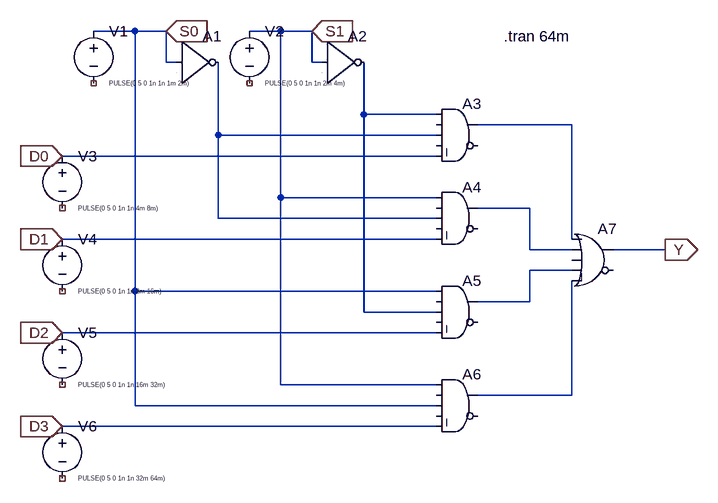
[diagram p0: schematic mux.asc]
mux.asc, the LTspice schematic file:
Version 4.1
SHEET 1 956 952
WIRE 64 224 0 224
WIRE 112 224 64 224
WIRE 288 224 240 224
WIRE 336 224 288 224
WIRE 112 272 112 224
WIRE 128 272 112 272
WIRE 336 272 336 224
WIRE 352 272 336 272
WIRE 416 352 416 272
WIRE 528 352 416 352
WIRE 736 368 592 368
WIRE 192 384 192 272
WIRE 528 384 192 384
WIRE 528 416 -48 416
WIRE 288 480 288 224
WIRE 528 480 288 480
WIRE 672 496 592 496
WIRE 192 512 192 384
WIRE 528 512 192 512
WIRE 528 544 -48 544
WIRE 736 544 736 368
WIRE 672 560 672 496
WIRE 736 560 672 560
WIRE 880 560 800 560
WIRE 736 592 672 592
WIRE 64 624 64 224
WIRE 528 624 64 624
WIRE 672 640 672 592
WIRE 672 640 592 640
WIRE 416 656 416 352
WIRE 528 656 416 656
WIRE 528 688 -48 688
WIRE 288 768 288 480
WIRE 528 768 288 768
WIRE 736 784 736 608
WIRE 736 784 592 784
WIRE 64 800 64 624
WIRE 528 800 64 800
WIRE 528 832 -48 832
FLAG 112 224 S0
IOPIN 112 224 In
FLAG 336 224 S1
IOPIN 336 224 In
FLAG 880 560 Y
IOPIN 880 560 Out
FLAG -48 416 D0
IOPIN -48 416 In
FLAG -48 544 D1
IOPIN -48 544 In
FLAG -48 688 D2
IOPIN -48 688 In
FLAG -48 832 D3
IOPIN -48 832 In
SYMBOL voltage 0 208 R0
WINDOW 3 24 96 Left 0
WINDOW 123 0 0 Left 0
WINDOW 39 0 0 Left 0
SYMATTR Value PULSE(0 5 0 1n 1n 1m 2m)
SYMATTR InstName V1
SYMBOL voltage 240 208 R0
WINDOW 3 24 96 Left 0
SYMATTR Value PULSE(0 5 0 1n 1n 2m 4m)
SYMATTR InstName V2
SYMBOL Digital\\inv 128 208 R0
SYMATTR InstName A1
SYMBOL Digital\\inv 352 208 R0
SYMATTR InstName A2
SYMBOL Digital\\and 560 320 R0
SYMATTR InstName A3
SYMBOL Digital\\and 560 448 R0
SYMATTR InstName A4
SYMBOL Digital\\and 560 592 R0
SYMATTR InstName A5
SYMBOL Digital\\and 560 736 R0
SYMATTR InstName A6
SYMBOL voltage -48 400 R0
WINDOW 3 24 96 Left 0
WINDOW 123 0 0 Left 0
WINDOW 39 0 0 Left 0
SYMATTR Value PULSE(0 5 0 1n 1n 4m 8m)
SYMATTR InstName V3
SYMBOL Digital\\or 768 512 R0
SYMATTR InstName A7
SYMBOL voltage -48 528 R0
WINDOW 3 24 96 Left 0
WINDOW 123 0 0 Left 0
WINDOW 39 0 0 Left 0
SYMATTR Value PULSE(0 5 0 1n 1n 8m 16m)
SYMATTR InstName V4
SYMBOL voltage -48 672 R0
WINDOW 3 24 96 Left 0
WINDOW 123 0 0 Left 0
WINDOW 39 0 0 Left 0
SYMATTR Value PULSE(0 5 0 1n 1n 16m 32m)
SYMATTR InstName V5
SYMBOL voltage -48 816 R0
WINDOW 3 24 96 Left 0
WINDOW 123 0 0 Left 0
WINDOW 39 0 0 Left 0
SYMATTR Value PULSE(0 5 0 1n 1n 32m 64m)
SYMATTR InstName V6
TEXT 632 232 Left 2 !.tran 64m

The netlist it stands for:
* mux.asc
V1 S0 NC_01 PULSE(0 5 0 1n 1n 1m 2m)
V2 S1 NC_02 PULSE(0 5 0 1n 1n 2m 4m)
A1 S0 0 0 0 0 N003 0 0 BUF
A2 S1 0 0 0 0 N001 0 0 BUF
A3 N001 0 N003 0 D0 0 N002 0 AND
A4 S1 0 N003 0 D1 0 N004 0 AND
A5 S0 0 N001 0 D2 0 N005 0 AND
A6 S1 0 S0 0 D3 0 N006 0 AND
V3 D0 NC_03 PULSE(0 5 0 1n 1n 4m 8m)
A7 N002 N004 0 N005 N006 0 Y 0 OR
V4 D1 NC_04 PULSE(0 5 0 1n 1n 8m 16m)
V5 D2 NC_05 PULSE(0 5 0 1n 1n 16m 32m)
V6 D3 NC_06 PULSE(0 5 0 1n 1n 32m 64m)
.tran 64m
.backanno
.end